# Altium schematic sheet Button_Section.SchDoc: =Projectname
size A4; SheetNumber: 4; SheetTotal: 4
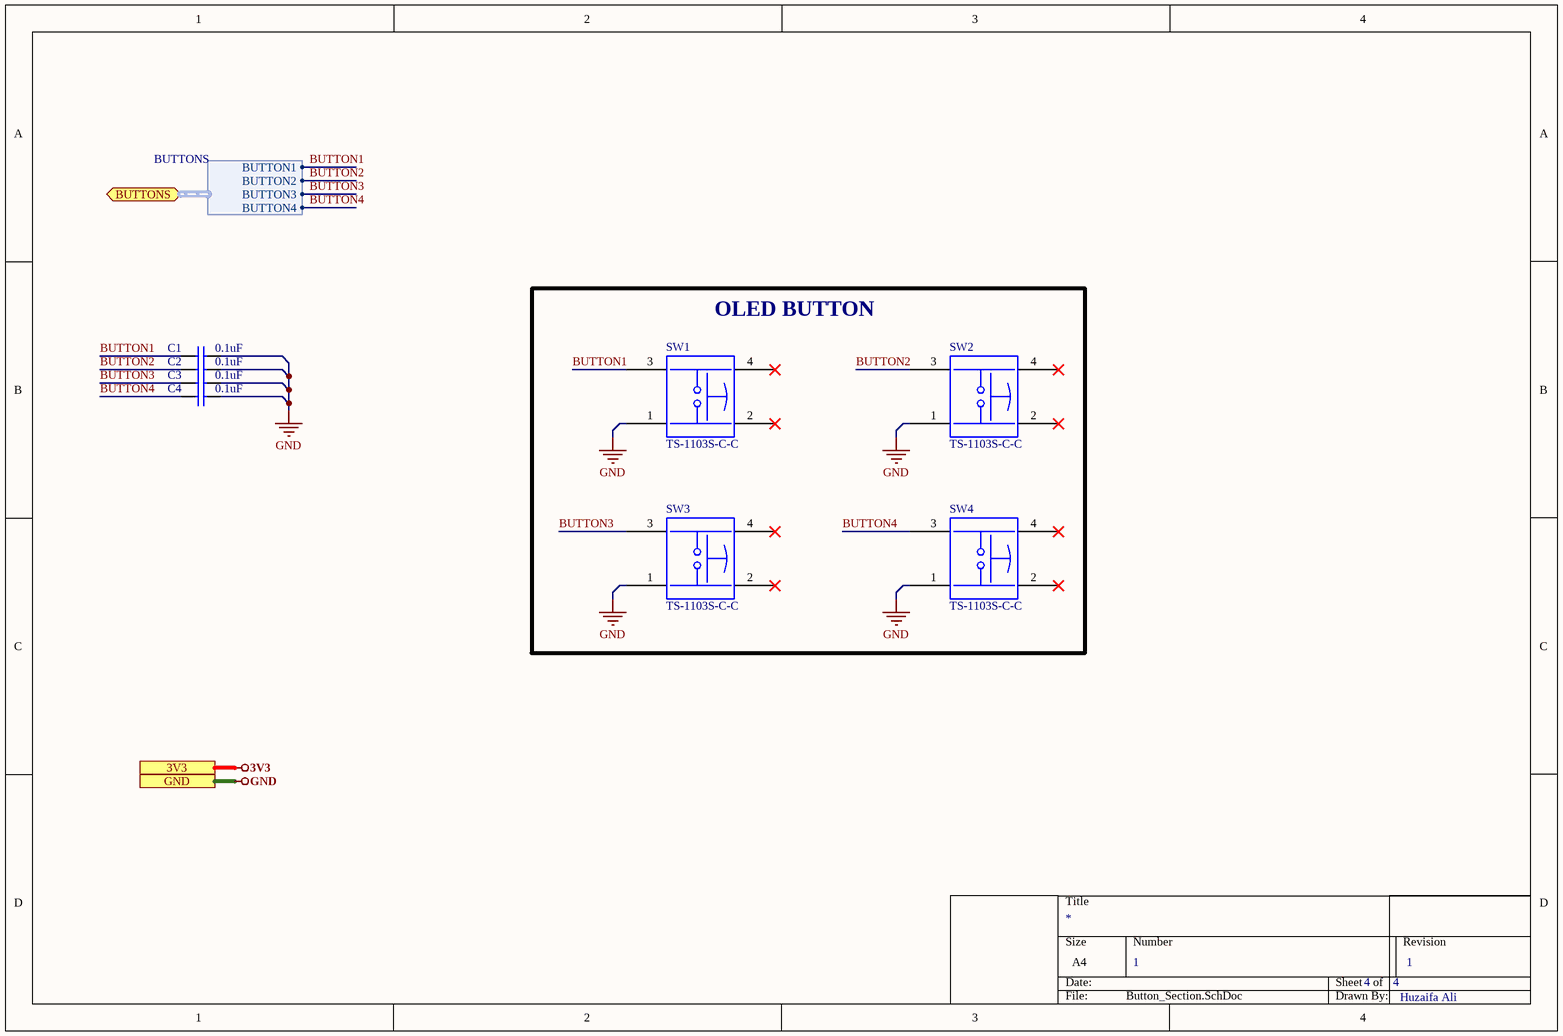
[diagram p0: Button_Section.SchDoc]

## Parts
C1  0.1uF  [Cap 0402]
C2  0.1uF  [Cap 0402]
C3  0.1uF  [Cap 0402]
C4  0.1uF  [Cap 0402]
SW1  TS-1103S-C-C  [TS-1103S-C-C]
SW2  TS-1103S-C-C  [TS-1103S-C-C]
SW3  TS-1103S-C-C  [TS-1103S-C-C]
SW4  TS-1103S-C-C  [TS-1103S-C-C]

## Blocks framed on the sheet
OLED BUTTON: SW1-SW4

## Ports
3V3, BUTTONS (bidir, harness BUTTONS), GND

## Harnesses
BUTTONS: BUTTON1, BUTTON2, BUTTON3, BUTTON4

## Nets
3V3: port 3V3
GND: C1.2 C2.2 C3.2 C4.2 SW1.1 SW2.1 SW3.1 SW4.1 ; port GND
BUTTON1: C1.1 SW1.3 ; port BUTTONS.BUTTON1
BUTTON2: C2.1 SW2.3 ; port BUTTONS.BUTTON2
BUTTON3: C3.1 SW3.3 ; port BUTTONS.BUTTON3
BUTTON4: C4.1 SW4.3 ; port BUTTONS.BUTTON4

Not connected (* = marked no-connect by the designer): SW1 2* 4*; SW2 2* 4*; SW3 2* 4*; SW4 2* 4*

## Notes on the sheet
- 1
- Huzaifa Ali

## Library data of the parts
C1-C4 = CC0402KRX7R7BB104: CAP CER 0.1UF 16V X7R 0402; Manufacturer: Yageo; Tolerance: 10%; Capacitance: 100nF; Supplier 1: Digi-Key; Manufacturer Part Number: CC0402KRX7R7BB104; Stock 1: 16982736; Pricing 1: 1=0.1, 10=0.034, 100=0.015, 500=0.0107, 1000=0.00841, 2500=0.00764, 5000=0.00703 (USD); Mount: Surface Mount; Case/Package: 0402; Number of Pins: 2; Case Code (Metric): 1005; Case Code (Imperial): 0402; Min Operating Temperature: -55°C; Max Operating Temperature: 125°C; Dielectric: X7R; Voltage Rating: 16V; Voltage Rating (DC): 16V; Packaging: Tape and Reel; Package Quantity: 1; Termination: SMD/SMT; Composition: Ceramic; Voltage: 16V; Length: 1mm; Height: 0.5mm; Width: 0.02inch; Thickness: 0.022inch; Depth: 0.5mm; Radiation Hardening: No; REACH SVHC: No SVHC; Lead Free: Lead Free; Halogen Free: Halogen Free; ComponentLink1URL: http://www.yageo.com/documents/recent/UPY-GPHC_X7R_6.3V-to-50V_8.pdf?src-supplier=Avnet+Europe; ComponentLink1Description: http://www.yageo.com/documents/recent/UPY-GPHC_X7R_6.3V-to-50V_8.pdf?src-supplier=Avnet+Europe; ComponentLink2URL: http://www.yageo.com/documents/recent/UPY-GPHC_X7R_6.3V-to-50V_18.pdf?src-supplier=Digi-Key; ComponentLink2Description: http://www.yageo.com/documents/recent/UPY-GPHC_X7R_6.3V-to-50V_18.pdf?src-supplier=Digi-Key; ComponentLink3URL: http://www.yageo.com/documents/recent/UPY-GPHC_X7R_6.3V-to-50V_8.pdf?src-supplier=Avnet; ComponentLink3Description: http://www.yageo.com/documents/recent/UPY-GPHC_X7R_6.3V-to-50V_8.pdf?src-supplier=Avnet; ComponentLink4URL: http://www.yageo.com/documents/recent/UPY-GPHC_X7R_6.3V-to-50V_18.pdf?src-supplier=Mouser; ComponentLink4Description: http://www.yageo.com/documents/recent/UPY-GPHC_X7R_6.3V-to-50V_18.pdf?src-supplier=Mouser; ComponentLink5URL: http://www.farnell.com/datasheets/2167236.pdf?src-supplier=Element14; ComponentLink5Description: http://www.farnell.com/datasheets/2167236.pdf?src-supplier=Element14; ComponentLink6URL: http://www.farnell.com/datasheets/1489800.pdf?src-supplier=Element14; ComponentLink6Description: http://www.farnell.com/datasheets/1489800.pdf?src-supplier=Element14; Supplier Part Number 1: 311-1338-1-ND
SW1-SW4 = TS-1103S-C-C: No NO 50mA 12mm 100mΩ 200000 260gf 12V -30℃~+85℃ 12mm 5mm Black Round Button Brick nogging SPST SMD Tactile Switches ROHS; Manufacturer: XKB; ComponentLink1Description: LCSC; ComponentLink1URL: https://lcsc.com/product-detail/Tactile-Switches_XKB-Connectivity-TS-1103S-C-C_C318916.html; Manufacturer Part No: TS-1103S-C-C; Package: Custom